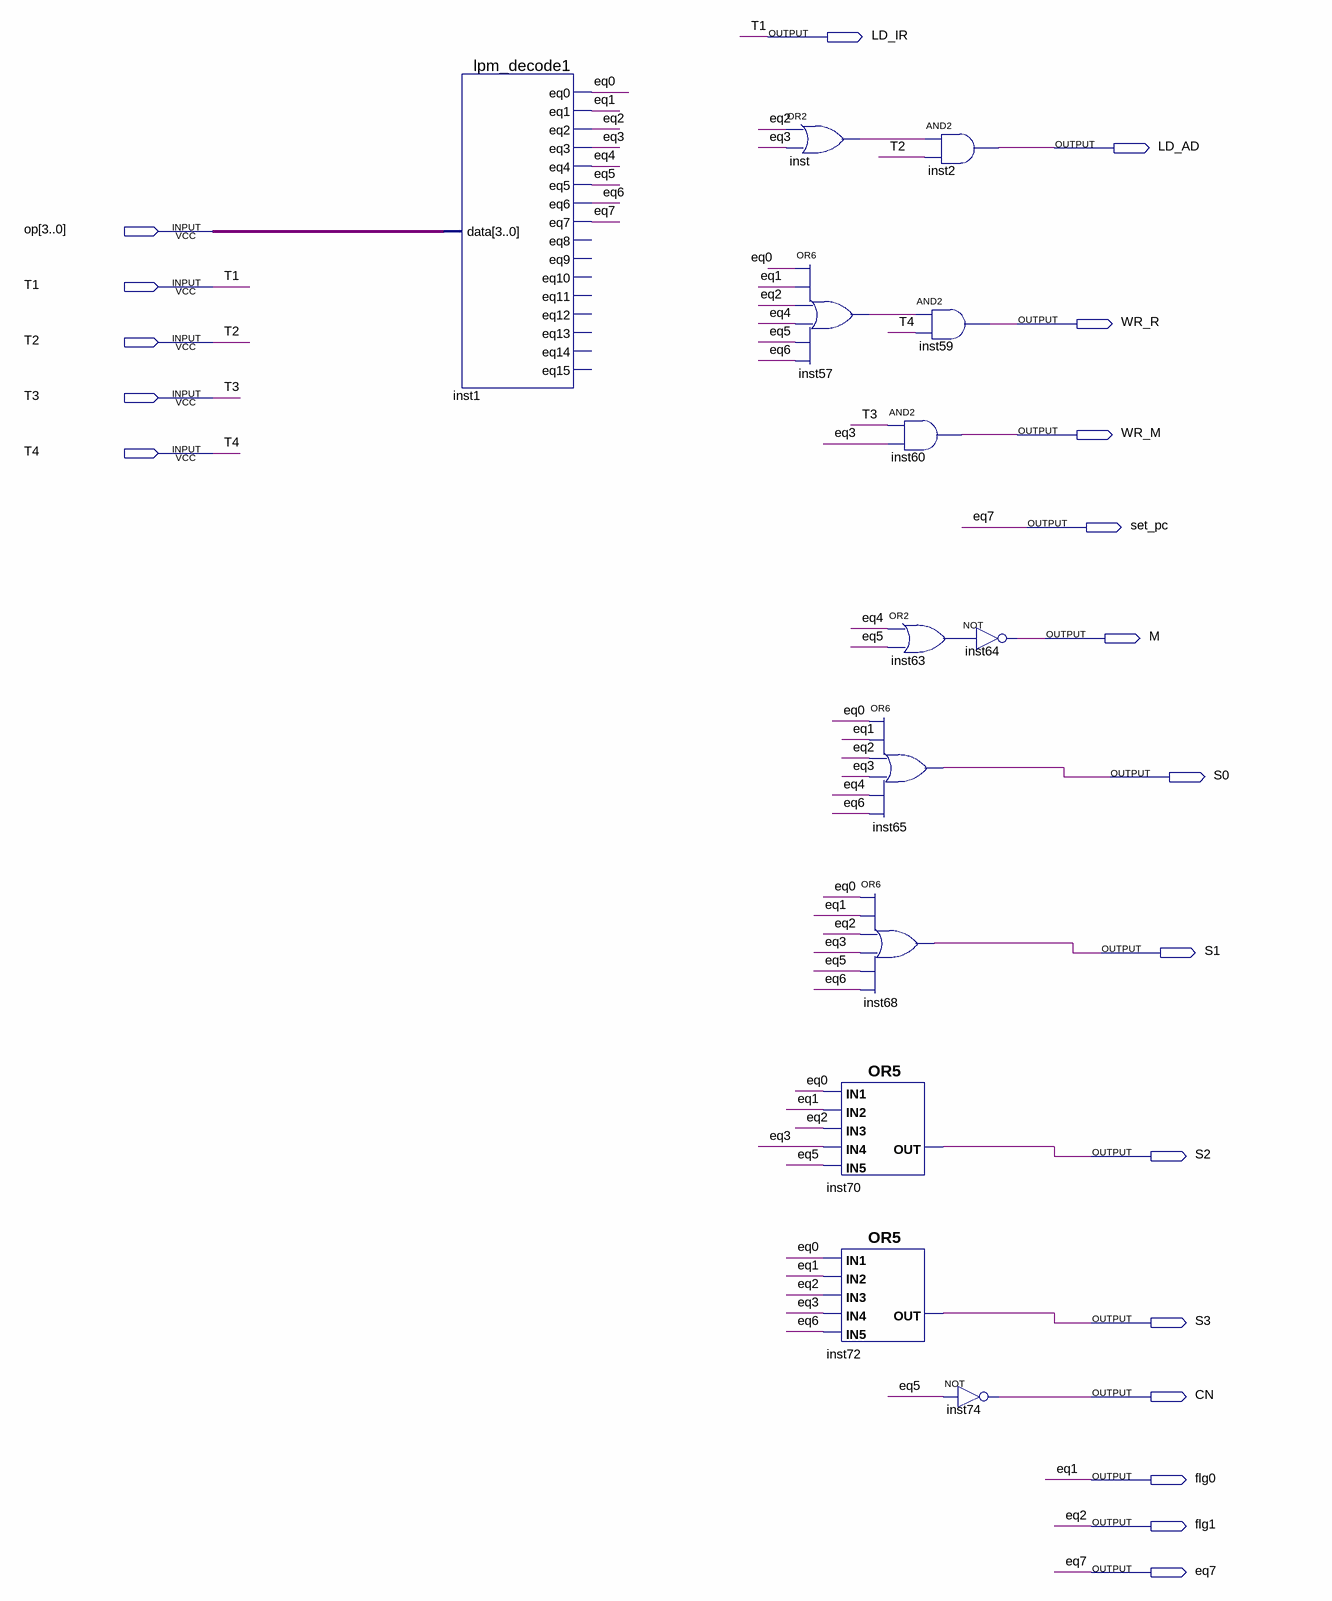
[diagram p0: schematic sheet]
// Quartus schematic OC_cpu_demo.bdf as structural Verilog: 13 symbols, 19 pins
module OC_cpu_demo (
  input  [3:0] op,
  input  T1,
  input  T2,
  input  T3,
  input  T4,
  output LD_IR,
  output LD_AD,
  output WR_R,
  output WR_M,
  output set_pc,
  output M,
  output S0,
  output S1,
  output S2,
  output S3,
  output CN,
  output flg0,
  output flg1,
  output eq7
);

  wire eq0, eq3, eq4, eq5, eq6, inst57_out, inst63_out, inst_out;

  lpm_decode1 inst1 (
    .data(op), .eq0(eq0), .eq1(flg0), .eq2(flg1), .eq3(eq3), .eq4(eq4), .eq5(eq5), .eq6(eq6), .eq7(eq7));  // open: eq8, eq9, eq10, eq11, eq12, eq13, eq14, eq15
  or inst (inst_out, flg1, eq3);
  or inst57 (inst57_out, eq0, flg0, flg1, eq4, eq5, eq6);
  or inst70 (S2, eq0, flg0, flg1, eq3, eq5);
  or inst72 (S3, eq0, flg0, flg1, eq3, eq6);
  and inst60 (WR_M, T3, eq3);
  or inst63 (inst63_out, eq4, eq5);
  or inst65 (S0, eq0, flg0, flg1, eq3, eq4, eq6);
  or inst68 (S1, eq0, flg0, flg1, eq3, eq5, eq6);
  and inst2 (LD_AD, inst_out, T2);
  and inst59 (WR_R, inst57_out, T4);
  not inst64 (M, inst63_out);
  not inst74 (CN, eq5);

  assign LD_IR = T1;
  assign set_pc = eq7;

  // Other names for the same wires on the sheet: eq1 = flg0; eq2 = flg1
endmodule
